# Altium schematic sheet 05_RTC.SchDoc
size A4; SheetNumber: 5; SheetTotal: 7
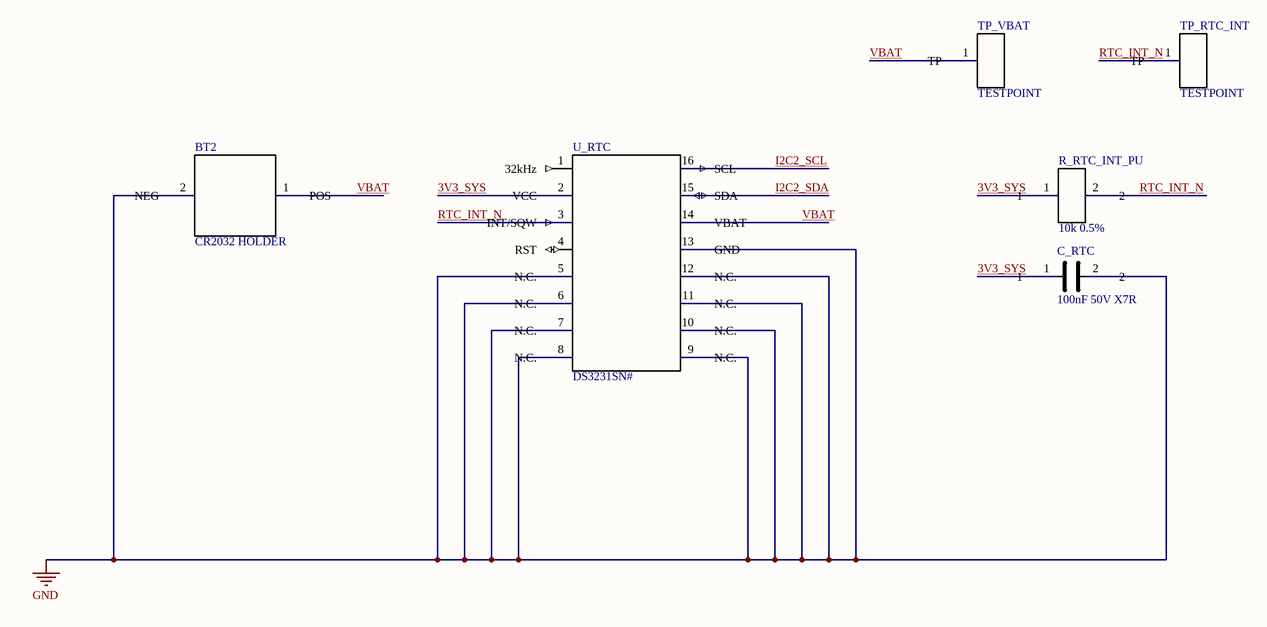
[diagram p0: 05_RTC.SchDoc]

## Parts
BT2  CR2032 HOLDER  [CR2032_HOLDER_VERTICAL_P20_D0P90_2P_THT_REV_B]
C_RTC  100nF 50V X7R  [SAMSUNG_CL10_0603_CAP_2P]
R_RTC_INT_PU  10k 0.5%  [RES_0805_SHARED_2P]
TP_RTC_INT  TESTPOINT  [TESTPOINT_GENERIC_1P5MM]
TP_VBAT  TESTPOINT  [TESTPOINT_GENERIC_1P5MM]
U_RTC  DS3231SN#  [MAXIM_W16H2_SO16_90_0107]

## Nets
GND: BT2.2(NEG) C_RTC.2 U_RTC.5(N.C.) U_RTC.6(N.C.) U_RTC.7(N.C.) U_RTC.8(N.C.) U_RTC.9(N.C.) U_RTC.10(N.C.) U_RTC.11(N.C.) U_RTC.12(N.C.) U_RTC.13(GND)
3V3_SYS: C_RTC.1 R_RTC_INT_PU.1 U_RTC.2(VCC)
I2C2_SCL: U_RTC.16(SCL)
I2C2_SDA: U_RTC.15(SDA)
RTC_INT_N: R_RTC_INT_PU.2 TP_RTC_INT.1(TP) U_RTC.3(INT/SQW)
VBAT: BT2.1(POS) TP_VBAT.1(TP) U_RTC.14(VBAT)

Not connected (* = marked no-connect by the designer): U_RTC 1(32kHz) 4(RST)

## Library data of the parts
BT2 = CR2032_HOLDER_USER_DRAWING: Datalogger Rev-A CR2032 vertical THT holder, user-confirmed drawing, 20.00 mm pitch; Manufacturer: UNKNOWN - USER DRAWING; Source_Baseline: Datalogger_RTC_CR2032_Final_BOM_RevA_v1.2_FA.pdf; Physical_Drawing: USER_CONFIRMED_CR2032_HOLDER_DRAWING_2026-08-22; PIN_NUMBER_SOURCE: INTERNAL_CONVENTION; PIN_FUNCTION_SOURCE: USER_CONFIRMED_PHYSICAL_DRAWING; Pin1_Function: POS_VBAT; Pin1_Physical: RIGHT_HOLE_X_PLUS_10P00_MM_TOP_VIEW; Pin2_Function: NEG_GND; Pin2_Physical: LEFT_HOLE_X_MINUS_10P00_MM_TOP_VIEW; Qualification_Status: UNQUALIFIED_PENDING_SAVE_REOPEN_AUDIT; MPN: UNKNOWN - USER DRAWING; Package: Vertical THT, 2-pin, 20.00 mm pitch; Footprint_Target: CR2032_HOLDER_P20_2P_THT
C_RTC = CL10B104KB8NNNC: MCU-core ceramic capacitor; Manufacturer: Samsung Electro-Mechanics; Source_Baseline: MCU_SCHEMATIC_ENTRY_BASELINE_v2.1_FA.txt; Design_Status: DESIGN_LOCK_MCU_CORE_V2.1_FOOTPRINT_HOLD; Qualification_Status: UNQUALIFIED_PENDING_SAVE_REOPEN_AUDIT; PIN_NUMBER_SOURCE: INTERNAL_CONVENTION; PIN_FUNCTION_SOURCE: MANUFACTURER_DATASHEET; MPN: CL10B104KB8NNNC; Value: 100nF 50V X7R; Package: 0603 / 1608 metric; Datasheet: https://product.samsungsem.com/mlcc/CL10B104KB8NNN.do
R_RTC_INT_PU = ARG05DTC1002: Precision power network resistor; Manufacturer: Viking Tech; Source_Baseline: POWER_SCHEMATIC_ENTRY_BASELINE_v0.17_FA.txt; Design_Status: DESIGN_LOCK_V0.17; Qualification_Status: UNQUALIFIED_PENDING_SAVE_REOPEN_AUDIT; PIN_NUMBER_SOURCE: INTERNAL_CONVENTION; PIN_FUNCTION_SOURCE: MANUFACTURER_DATASHEET; MPN: ARG05DTC1002; Value: 10k 0.5%; Package: 0805 / ARG05; Datasheet: Viking Tech AR series product data
TP_RTC_INT TP_VBAT = TESTPOINT_GENERIC: Generic schematic test point; Manufacturer: PROJECT_LOGICAL; Source_Baseline: POWER_SCHEMATIC_ENTRY_BASELINE_v0.17_FA.txt; Qualification_Status: UNQUALIFIED_PENDING_SAVE_REOPEN_AUDIT; PIN_NUMBER_SOURCE: PROJECT_LOGICAL_DEFINITION; MPN: TESTPOINT_GENERIC; Value: TESTPOINT; Package: LOGICAL; Datasheet: POWER_SCHEMATIC_ENTRY_BASELINE_v0.17_FA.txt; Design_Status: PROJECT_LOGICAL; PIN_FUNCTION_SOURCE: PROJECT_LOGICAL_DEFINITION
U_RTC = DS3231SN#: Analog Devices/Maxim DS3231 industrial I2C RTC/TCXO, 16-SO W16#H2; Manufacturer: Analog Devices / Maxim Integrated; Package_Outline: 21-0042; Land_Pattern: 90-0107; Source_Baseline: Datalogger_RTC_CR2032_Final_BOM_RevA_v1.2_FA.pdf; PIN_NUMBER_SOURCE: MANUFACTURER_DATASHEET; Qualification_Status: UNQUALIFIED_PENDING_SAVE_REOPEN_AUDIT; MPN: DS3231SN#; Package: 16 SO, 300 mil, W16#H2; Datasheet: Analog Devices DS3231 Rev.10; PIN_FUNCTION_SOURCE: MANUFACTURER_DATASHEET